# Altium project Audio_Meter_V3.2.PrjPcb (part 2 of 6)

## Sheet Audio_Section.SchDoc
size A; DocumentNumber: 6; SheetNumber: 6; SheetTotal: 8
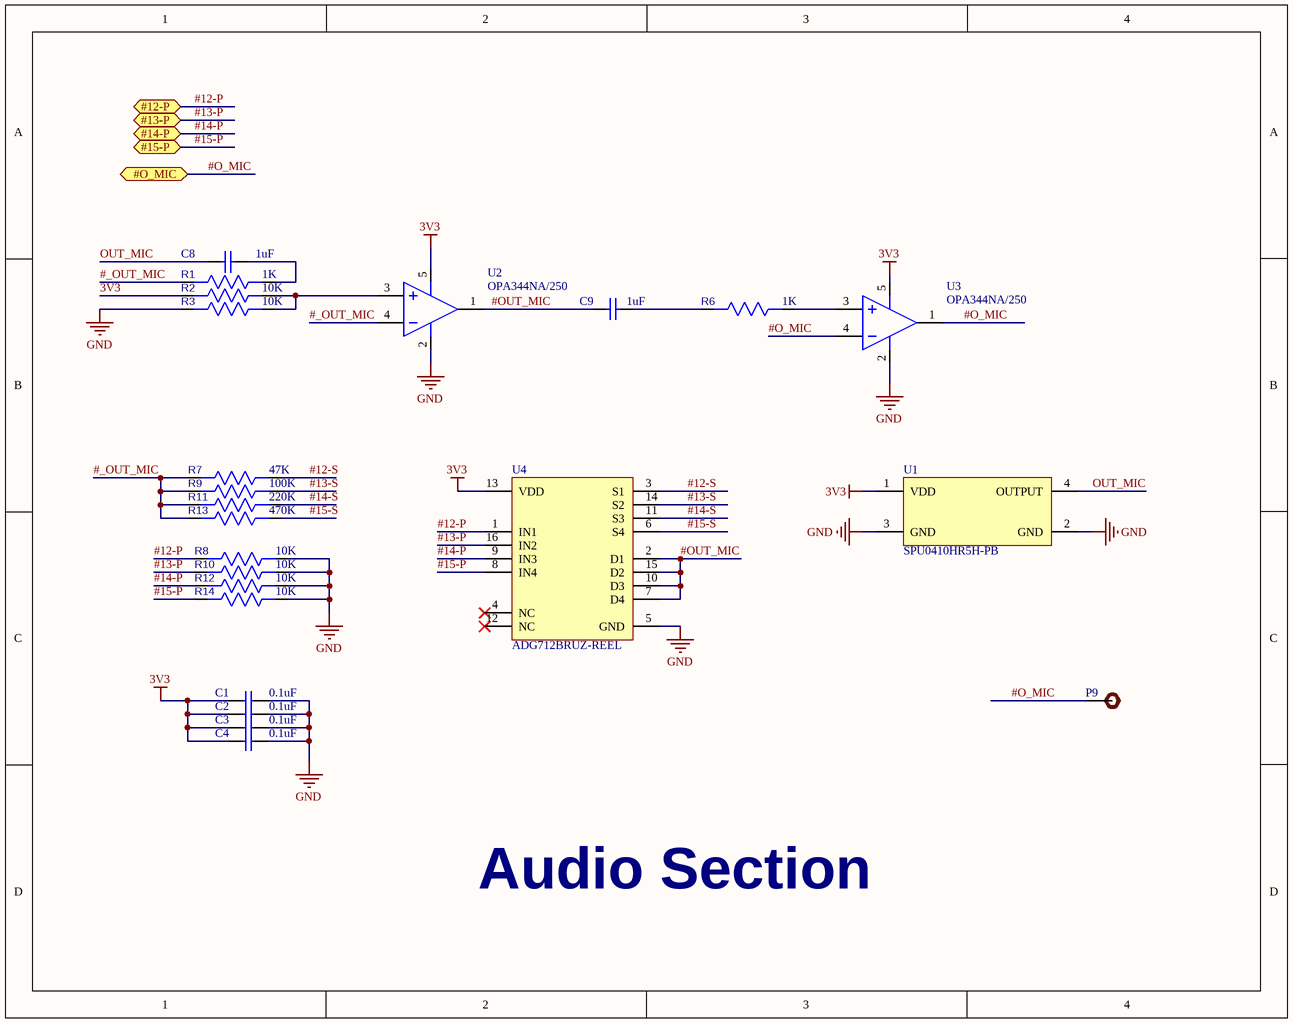
[diagram p2: Audio_Section.SchDoc]

### Parts
C1  0.1uF  [Cap0805]
C2  0.1uF  [Cap0805]
C3  0.1uF  [Cap0805]
C4  0.1uF  [Cap0805]
C8  Capacitance: 1uF  [Cap1206]  (hidden comment: 1206YC105K4T2A)
C9  Capacitance: 1uF  [Cap1206]  (hidden comment: 1206YC105K4T2A)
P9  TEST POINT  [TEST POINT]  (value not drawn)
R1  1K  [RES0805]
R2  10K  [RES0805]
R3  10K  [RES0805]
R6  1K  [RES0805]
R7  47K  [RES0805]
R8  10K  [RES0805]
R9  100K  [RES0805]
R10  10K  [RES0805]
R11  220K  [RES0805]
R12  10K  [RES0805]
R13  470K  [RES0805]
R14  10K  [RES0805]
U1  SPU0410HR5H-PB  [SPU0410HR5H-PB]
U2  OPA344NA/250  [SOT23-5]
U3  OPA344NA/250  [SOT23-5]
U4  ADG712BRUZ-REEL  [16-TSSOP]

### Ports
#12-P (bidir), #13-P (bidir), #14-P (bidir), #15-P (bidir), #O_MIC (bidir)

### Nets
3V3: C1.1 C2.1 C3.1 C4.1 R2.2 U1.1(VDD) U2.5(V+) U3.5(V+) U4.13(VDD)
GND: C1.2 C2.2 C3.2 C4.2 R3.2 R8.1 R10.1 R12.1 R14.1 U1.2(GND) U1.3(GND) U2.2(V-) U3.2(V-) U4.5(GND)
#12-P: R8.2 U4.1(IN1) ; port #12-P
#12-S: R7.1 U4.3(S1)
#13-P: R10.2 U4.16(IN2) ; port #13-P
#13-S: R9.1 U4.14(S2)
#14-P: R12.2 U4.9(IN3) ; port #14-P
#14-S: R11.1 U4.11(S3)
#15-P: R14.2 U4.8(IN4) ; port #15-P
#15-S: R13.1 U4.6(S4)
#_OUT_MIC: R1.2 R7.2 R9.2 R11.2 R13.2 U2.4(IN-)
#O_MIC: P9.1 U3.1(OUT) U3.4(IN-) ; port #O_MIC
#OUT_MIC: C9.1 U2.1(OUT) U4.2(D1) U4.7(D4) U4.10(D3) U4.15(D2)
OUT_MIC: C8.1 U1.4(OUTPUT)
NetC8_2: C8.2 R1.1
NetC9_2: C9.2 R6.2
NetR2_1: R2.1 R3.1 U2.3(IN+)
NetR6_1: R6.1 U3.3(IN+)

Not connected (* = marked no-connect by the designer): U4 4(NC)* 12(NC)*

### Notes on the sheet
- Audio Section

### Library data of the parts
C1-C4 = CL21F104ZBCNNNC: CAP CER 0.1UF 50V Y5V 0805; Manufacturer: Samsung; Material: Ceramic; Capacitance: 100nF; Tolerance: 80%; Supplier 1: Digi-Key; Manufacturer Part Number: CL21F104ZBCNNNC; Stock 1: 4901061; Pricing 1: 1=0.1, 10=0.044, 100=0.0195, 500=0.0139, 1000=0.01092 (USD); Mount: Surface Mount; Case/Package: 0805; Case Code (Metric): 2012; Case Code (Imperial): 0805; Min Operating Temperature: -30°C; Max Operating Temperature: 85°C; Dielectric: Y5V; Packaging: Tape and Reel; Voltage Rating: 50V; Package Quantity: 1; Length: 2mm; Height: 0.85mm; Width: 0.049inch; Thickness: 0.037inch; Depth: 1.25mm; Radiation Hardening: No; ComponentLink1URL: https://media.digikey.com/pdf/Data%20Sheets/Samsung%20PDFs/CL_Series_MLCC_ds.pdf?src-supplier=Digi-Key; ComponentLink1Description: https://media.digikey.com/pdf/Data%20Sheets/Samsung%20PDFs/CL_Series_MLCC_ds.pdf?src-supplier=Digi-Key; Supplier Part Number 1: 1276-1007-6-ND
C8 C9 = 1206YC105K4T2A: CAP CER 1UF 16V X7R 1206; Manufacturer: Kyocera AVX; Tolerance: 10%; Supplier 1: Digi-Key; Manufacturer Part Number: 1206YC105K4T2A; Stock 1: 1895; Pricing 1: 1=0.41, 10=0.285, 100=0.1708, 500=0.12808, 1000=0.10816 (USD); Mount: Surface Mount; Case/Package: 1206; Case Code (Imperial): 1206; Case Code (Metric): 3216; Min Operating Temperature: -55°C; Max Operating Temperature: 125°C; Dielectric: X7R; Package Quantity: 2000; Voltage Rating: 16V; Voltage Rating (DC): 16V; Packaging: Tape and Reel; Termination: SMD/SMT; Length: 3.2mm; Depth: 1.6mm; Width: 1.6mm; Thickness: 0.037inch; Ratings: AEC-Q200; Radiation Hardening: No; Lead Free: Lead Free; ComponentLink1URL: http://www.mouser.com/ds/2/40/AutoMLCC-777028.pdf?src-supplier=Mouser; ComponentLink1Description: http://www.mouser.com/ds/2/40/AutoMLCC-777028.pdf?src-supplier=Mouser; ComponentLink2URL: http://www.avxcorp.com/docs/Catalogs/cauto.pdf?src-supplier=Avnet; ComponentLink2Description: http://www.avxcorp.com/docs/Catalogs/cauto.pdf?src-supplier=Avnet; ComponentLink3URL: http://www.avx.com/docs/Catalogs/cauto.pdf?src-supplier=Future+Electronics; ComponentLink3Description: http://www.avx.com/docs/Catalogs/cauto.pdf?src-supplier=Future+Electronics; ComponentLink4URL: http://www.avx.com/docs/Catalogs/cx7r.pdf?src-supplier=Digi-Key; ComponentLink4Description: http://www.avx.com/docs/Catalogs/cx7r.pdf?src-supplier=Digi-Key; Supplier Part Number 1: 478-10899-1-ND
P9 = TEST POINT: Test Point ON
R1 R6 = ERJ-P06J102V: RES SMD 1K OHM 5% 1/2W 0805; Manufacturer: Panasonic; Power Rating: 500mW; Voltage Rating: 400V; Temperature Coefficient: 200ppm/°C; Voltage Rating (DC): 150V; ComponentLink1URL: https://datasheet.ciiva.com/2474/crcwhpe3-2474640.pdf; ComponentLink1Description: https://datasheet.ciiva.com/2474/crcwhpe3-2474640.pdf; ComponentLink2URL: https://datasheet.ciiva.com/48527/crcwhpe3-48527638.pdf; ComponentLink2Description: https://datasheet.ciiva.com/48527/crcwhpe3-48527638.pdf; ComponentLink3URL: https://datasheet.ciiva.com/5547/crcwhpe3-46056-5547896.pdf; ComponentLink3Description: https://datasheet.ciiva.com/5547/crcwhpe3-46056-5547896.pdf; ComponentLink4URL: https://datasheet.ciiva.com/9112/crcwhpe3-9112140.pdf; ComponentLink4Description: https://datasheet.ciiva.com/9112/crcwhpe3-9112140.pdf; ComponentLink5URL: https://datasheet.ciiva.com/2474/crcwhpe3-2474638.pdf; ComponentLink5Description: https://datasheet.ciiva.com/2474/crcwhpe3-2474638.pdf; ComponentLink6URL: https://datasheet.ciiva.com/2474/crcwhpe3-2474639.pdf; ComponentLink6Description: https://datasheet.ciiva.com/2474/crcwhpe3-2474639.pdf; ComponentLink7URL: https://datasheet.ciiva.com/2474/crcwhpe3-2474641.pdf; ComponentLink7Description: https://datasheet.ciiva.com/2474/crcwhpe3-2474641.pdf; ComponentLink8URL: https://datasheet.ciiva.com/2474/crcwhpe3-2474642.pdf; ComponentLink8Description: https://datasheet.ciiva.com/2474/crcwhpe3-2474642.pdf; ComponentLink9URL: https://datasheet.ciiva.com/2474/crcwhpe3-2474643.pdf; ComponentLink9Description: https://datasheet.ciiva.com/2474/crcwhpe3-2474643.pdf; ComponentLink10URL: https://datasheet.ciiva.com/9051/crcwhpe3-9051301.pdf; ComponentLink10Description: https://datasheet.ciiva.com/9051/crcwhpe3-9051301.pdf; Supplier 1: Digi-Key; Manufacturer Part Number: ERJ-P06J102V; Stock 1: 475568; Pricing 1: 1=0.11, 10=0.103, 100=0.0396, 1000=0.0174, 2500=0.0151 (USD); Mount: Surface Mount; Case/Package: 0805; Weight: 0.000194oz; Case Code (Metric): 2012; Case Code (Imperial): 0805; Contact Plating: Tin; Min Operating Temperature: -55°C; Max Operating Temperature: 155°C; Resistance: 1K; Tolerance: 5%; Packaging: Tape and Reel; Package Quantity: 1; Composition: Thick Film; Number of Terminations: 2; Termination: SMD/SMT; Military Standard: Not; Max Power Dissipation: 500mW; Features: Automotive AEC-Q200; Length: 2mm; Height: 0.6mm; Width: 0.049inch; Depth: 1.25mm; Radiation Hardening: No; REACH SVHC: Unknown; Lead Free: Lead Free; ComponentLink11URL: http://uk.rs-online.com/webdocs/12cb/0900766b812cb812.pdf?src-supplier=RSComponents; ComponentLink11Description: http://uk.rs-online.com/webdocs/12cb/0900766b812cb812.pdf?src-supplier=RSComponents; ComponentLink12URL: http://www.mouser.com/ds/2/315/AOA0000C291-1101061.pdf?src-supplier=Mouser; ComponentLink12Description: http://www.mouser.com/ds/2/315/AOA0000C291-1101061.pdf?src-supplier=Mouser; ComponentLink13URL: http://www.industrial.panasonic.com/www-data/pdf/AOA0000/AOA0000CE4.pdf?src-supplier=Element14; ComponentLink13Description: http://www.industrial.panasonic.com/www-data/pdf/AOA0000/AOA0000CE4.pdf?src-supplier=Element14; ComponentLink14URL: http://industrial.panasonic.com/www-data/pdf/AOA0000/AOA0000CE4.pdf?src-supplier=Avnet+Europe; ComponentLink14Description: http://industrial.panasonic.com/www-data/pdf/AOA0000/AOA0000CE4.pdf?src-supplier=Avnet+Europe; ComponentLink15URL: http://www.farnell.com/datasheets/2059624.pdf?src-supplier=Farnell; ComponentLink15Description: http://www.farnell.com/datasheets/2059624.pdf?src-supplier=Farnell; ComponentLink16URL: https://www.alliedelec.com/m/d/12e4be79354a6c30aae91f11e8182ea0.pdf?src-supplier=Allied+Electronics; ComponentLink16Description: https://www.alliedelec.com/m/d/12e4be79354a6c30aae91f11e8182ea0.pdf?src-supplier=Allied+Electronics; Supplier Part Number 1: P1.0KADCT-ND
R2 R3 R8 R10 R12 R14 = ERJ-P06J103V: RES SMD 10K OHM 5% 1/2W 0805; Manufacturer: Panasonic; Power Rating: 500mW; Voltage Rating: 400V; Temperature Coefficient: 200ppm/°C; Voltage Rating (DC): 150V; ComponentLink1URL: https://www.verical.com/server-webapp/html/getDatasheet?partID=409513; ComponentLink1Description: https://www.verical.com/server-webapp/html/getDatasheet?partID=409513; ComponentLink2URL: http://components.arrow.com/part/dataview/44988207S7163511N1174; ComponentLink2Description: http://components.arrow.com/part/dataview/44988207S7163511N1174; ComponentLink3URL: https://www.seielect.com/Catalog/SEI-RMCF_RMCP.pdf; ComponentLink3Description: https://www.seielect.com/Catalog/SEI-RMCF_RMCP.pdf; ComponentLink4URL: http://www.seielect.com/catalog/sei-rmc.pdf; ComponentLink4Description: http://www.seielect.com/catalog/sei-rmc.pdf; ComponentLink5URL: https://datasheet.ciiva.com/7777/424479-7777391.pdf; ComponentLink5Description: https://datasheet.ciiva.com/7777/424479-7777391.pdf; ComponentLink6URL: https://datasheet.ciiva.com/2581/crcwhpe3-2581488.pdf; ComponentLink6Description: https://datasheet.ciiva.com/2581/crcwhpe3-2581488.pdf; ComponentLink7URL: https://datasheet.ciiva.com/11808/0900766b80d98b26-11808546.pdf; ComponentLink7Description: https://datasheet.ciiva.com/11808/0900766b80d98b26-11808546.pdf; ComponentLink8URL: https://datasheet.ciiva.com/8934/dcrcwe3-8934585.pdf; ComponentLink8Description: https://datasheet.ciiva.com/8934/dcrcwe3-8934585.pdf; ComponentLink9URL: https://datasheet.ciiva.com/2467/dcrcwe3-2467241.pdf; ComponentLink9Description: https://datasheet.ciiva.com/2467/dcrcwe3-2467241.pdf; ComponentLink10URL: https://datasheet.ciiva.com/7777/1697337-7777401.pdf; ComponentLink10Description: https://datasheet.ciiva.com/7777/1697337-7777401.pdf; ComponentLink11URL: https://datasheet.ciiva.com/16852/dcrcwe3-16852347.pdf; ComponentLink11Description: https://datasheet.ciiva.com/16852/dcrcwe3-16852347.pdf; ComponentLink12URL: https://datasheet.ciiva.com/16200/dcrcwe3-16200123.pdf; ComponentLink12Description: https://datasheet.ciiva.com/16200/dcrcwe3-16200123.pdf; ComponentLink13URL: https://datasheet.ciiva.com/16725/70201119-16725227.pdf; ComponentLink13Description: https://datasheet.ciiva.com/16725/70201119-16725227.pdf; ComponentLink14URL: https://datasheet.ciiva.com/2467/dcrcwe3-2467239.pdf; ComponentLink14Description: https://datasheet.ciiva.com/2467/dcrcwe3-2467239.pdf; ComponentLink15URL: https://datasheet.ciiva.com/7777/1720486-7777575.pdf; ComponentLink15Description: https://datasheet.ciiva.com/7777/1720486-7777575.pdf; ComponentLink16URL: https://datasheet.ciiva.com/8934/dcrcwe3-8934581.pdf; ComponentLink16Description: https://datasheet.ciiva.com/8934/dcrcwe3-8934581.pdf; ComponentLink17URL: https://datasheet.ciiva.com/2467/dcrcwe3-2467240.pdf; ComponentLink17Description: https://datasheet.ciiva.com/2467/dcrcwe3-2467240.pdf; ComponentLink18URL: https://datasheet.ciiva.com/7777/1720486-7777576.pdf; ComponentLink18Description: https://datasheet.ciiva.com/7777/1720486-7777576.pdf; ComponentLink19URL: https://datasheet.ciiva.com/5546/dcrcwe3-109170-5546983.pdf; ComponentLink19Description: https://datasheet.ciiva.com/5546/dcrcwe3-109170-5546983.pdf; ComponentLink20URL: https://datasheet.ciiva.com/16755/70201119-16755757.pdf; ComponentLink20Description: https://datasheet.ciiva.com/16755/70201119-16755757.pdf; ComponentLink21URL: https://datasheet.ciiva.com/3258/dcrcwe3-3258221.pdf; ComponentLink21Description: https://datasheet.ciiva.com/3258/dcrcwe3-3258221.pdf; ComponentLink22URL: https://datasheet.ciiva.com/17204/dcrcwe3-17204398.pdf; ComponentLink22Description: https://datasheet.ciiva.com/17204/dcrcwe3-17204398.pdf; ComponentLink23URL: https://datasheet.ciiva.com/16435/dcrcwe3-16435934.pdf; ComponentLink23Description: https://datasheet.ciiva.com/16435/dcrcwe3-16435934.pdf; ComponentLink24URL: https://datasheet.ciiva.com/46441/1533075-46441628.pdf; ComponentLink24Description: https://datasheet.ciiva.com/46441/1533075-46441628.pdf; ComponentLink25URL: https://datasheet.ciiva.com/5544/dcrcwe3-109170-5544649.pdf; ComponentLink25Description: https://datasheet.ciiva.com/5544/dcrcwe3-109170-5544649.pdf; ComponentLink26URL: https://datasheet.ciiva.com/8337/dcrcwe3-8337669.pdf; ComponentLink26Description: https://datasheet.ciiva.com/8337/dcrcwe3-8337669.pdf; ComponentLink27URL: https://datasheet.ciiva.com/2463/dcrcwe3-2463179.pdf; ComponentLink27Description: https://datasheet.ciiva.com/2463/dcrcwe3-2463179.pdf; ComponentLink28URL: https://datasheet.ciiva.com/2463/dcrcwe3-2463178.pdf; ComponentLink28Description: https://datasheet.ciiva.com/2463/dcrcwe3-2463178.pdf; ComponentLink29URL: https://datasheet.ciiva.com/2474/crcwhpe3-2474640.pdf; ComponentLink29Description: https://datasheet.ciiva.com/2474/crcwhpe3-2474640.pdf; ComponentLink30URL: https://datasheet.ciiva.com/48527/crcwhpe3-48527638.pdf; ComponentLink30Description: https://datasheet.ciiva.com/48527/crcwhpe3-48527638.pdf; ComponentLink31URL: https://datasheet.ciiva.com/5547/crcwhpe3-46056-5547896.pdf; ComponentLink31Description: https://datasheet.ciiva.com/5547/crcwhpe3-46056-5547896.pdf; ComponentLink32URL: https://datasheet.ciiva.com/9112/crcwhpe3-9112140.pdf; ComponentLink32Description: https://datasheet.ciiva.com/9112/crcwhpe3-9112140.pdf; ComponentLink33URL: https://datasheet.ciiva.com/2474/crcwhpe3-2474638.pdf; ComponentLink33Description: https://datasheet.ciiva.com/2474/crcwhpe3-2474638.pdf; ComponentLink34URL: https://datasheet.ciiva.com/2474/crcwhpe3-2474639.pdf; ComponentLink34Description: https://datasheet.ciiva.com/2474/crcwhpe3-2474639.pdf; Supplier 1: Digi-Key; Manufacturer Part Number: ERJ-P06J103V; Stock 1: 130484; Pricing 1: 1=0.11, 10=0.103, 100=0.0396, 1000=0.0174, 2500=0.0151 (USD); Mount: Surface Mount; Case/Package: 0805; Weight: 0.000194oz; Case Code (Metric): 2012; Case Code (Imperial): 0805; Contact Plating: Tin; Min Operating Temperature: -55°C; Max Operating Temperature: 155°C; Resistance: 10K; Tolerance: 5%; Packaging: Tape and Reel; Package Quantity: 1; Composition: Thick Film; Number of Terminations: 2; Termination: SMD/SMT; Military Standard: Not; Max Power Dissipation: 500mW; Features: Automotive AEC-Q200; Length: 2mm; Height: 0.6mm; Width: 0.049inch; Depth: 1.25mm; Radiation Hardening: No; REACH SVHC: Unknown; Lead Free: Lead Free; ComponentLink35URL: http://uk.rs-online.com/webdocs/12cb/0900766b812cb812.pdf?src-supplier=RSComponents; ComponentLink35Description: http://uk.rs-online.com/webdocs/12cb/0900766b812cb812.pdf?src-supplier=RSComponents; ComponentLink36URL: http://industrial.panasonic.com/www-data/pdf/AOA0000/AOA0000CE4.pdf?src-supplier=Avnet; ComponentLink36Description: http://industrial.panasonic.com/www-data/pdf/AOA0000/AOA0000CE4.pdf?src-supplier=Avnet; ComponentLink37URL: http://industrial.panasonic.com/www-data/pdf/AOA0000/AOA0000CE4.pdf?src-supplier=Future+Electronics; ComponentLink37Description: http://industrial.panasonic.com/www-data/pdf/AOA0000/AOA0000CE4.pdf?src-supplier=Future+Electronics; ComponentLink38URL: http://www.farnell.com/datasheets/2059624.pdf?src-supplier=Element14; ComponentLink38Description: http://www.farnell.com/datasheets/2059624.pdf?src-supplier=Element14; ComponentLink39URL: https://www.alliedelec.com/m/d/12e4be79354a6c30aae91f11e8182ea0.pdf?src-supplier=Allied+Electronics; ComponentLink39Description: https://www.alliedelec.com/m/d/12e4be79354a6c30aae91f11e8182ea0.pdf?src-supplier=Allied+Electronics; ComponentLink40URL: http://www.farnell.com/datasheets/2059624.pdf?src-supplier=Farnell; ComponentLink40Description: http://www.farnell.com/datasheets/2059624.pdf?src-supplier=Farnell; Supplier Part Number 1: P10KADCT-ND
R7 = CRCW080547K0FKEAHP: RES SMD 47K OHM 1% 1/3W 0805; Manufacturer: Vishay; Power Rating: 330mW; Temperature Coefficient: 100ppm/°C; Voltage Rating: 150V; Max Power Dissipation: 333mW; ComponentLink1URL: https://www.verical.com/server-webapp/html/getDatasheet?partID=409513; ComponentLink1Description: https://www.verical.com/server-webapp/html/getDatasheet?partID=409513; ComponentLink2URL: http://components.arrow.com/part/dataview/44988207S7163511N1174; ComponentLink2Description: http://components.arrow.com/part/dataview/44988207S7163511N1174; ComponentLink3URL: https://www.seielect.com/Catalog/SEI-RMCF_RMCP.pdf; ComponentLink3Description: https://www.seielect.com/Catalog/SEI-RMCF_RMCP.pdf; ComponentLink4URL: http://www.seielect.com/catalog/sei-rmc.pdf; ComponentLink4Description: http://www.seielect.com/catalog/sei-rmc.pdf; ComponentLink5URL: https://datasheet.ciiva.com/7777/424479-7777391.pdf; ComponentLink5Description: https://datasheet.ciiva.com/7777/424479-7777391.pdf; ComponentLink6URL: https://datasheet.ciiva.com/2581/crcwhpe3-2581488.pdf; ComponentLink6Description: https://datasheet.ciiva.com/2581/crcwhpe3-2581488.pdf; ComponentLink7URL: https://datasheet.ciiva.com/11808/0900766b80d98b26-11808546.pdf; ComponentLink7Description: https://datasheet.ciiva.com/11808/0900766b80d98b26-11808546.pdf; ComponentLink8URL: https://datasheet.ciiva.com/8934/dcrcwe3-8934585.pdf; ComponentLink8Description: https://datasheet.ciiva.com/8934/dcrcwe3-8934585.pdf; ComponentLink9URL: https://datasheet.ciiva.com/2467/dcrcwe3-2467241.pdf; ComponentLink9Description: https://datasheet.ciiva.com/2467/dcrcwe3-2467241.pdf; ComponentLink10URL: https://datasheet.ciiva.com/7777/1697337-7777401.pdf; ComponentLink10Description: https://datasheet.ciiva.com/7777/1697337-7777401.pdf; ComponentLink11URL: https://datasheet.ciiva.com/16852/dcrcwe3-16852347.pdf; ComponentLink11Description: https://datasheet.ciiva.com/16852/dcrcwe3-16852347.pdf; ComponentLink12URL: https://datasheet.ciiva.com/16200/dcrcwe3-16200123.pdf; ComponentLink12Description: https://datasheet.ciiva.com/16200/dcrcwe3-16200123.pdf; ComponentLink13URL: https://datasheet.ciiva.com/16725/70201119-16725227.pdf; ComponentLink13Description: https://datasheet.ciiva.com/16725/70201119-16725227.pdf; ComponentLink14URL: https://datasheet.ciiva.com/2467/dcrcwe3-2467239.pdf; ComponentLink14Description: https://datasheet.ciiva.com/2467/dcrcwe3-2467239.pdf; ComponentLink15URL: https://datasheet.ciiva.com/7777/1720486-7777575.pdf; ComponentLink15Description: https://datasheet.ciiva.com/7777/1720486-7777575.pdf; ComponentLink16URL: https://datasheet.ciiva.com/8934/dcrcwe3-8934581.pdf; ComponentLink16Description: https://datasheet.ciiva.com/8934/dcrcwe3-8934581.pdf; ComponentLink17URL: https://datasheet.ciiva.com/2467/dcrcwe3-2467240.pdf; ComponentLink17Description: https://datasheet.ciiva.com/2467/dcrcwe3-2467240.pdf; ComponentLink18URL: https://datasheet.ciiva.com/7777/1720486-7777576.pdf; ComponentLink18Description: https://datasheet.ciiva.com/7777/1720486-7777576.pdf; ComponentLink19URL: https://datasheet.ciiva.com/5546/dcrcwe3-109170-5546983.pdf; ComponentLink19Description: https://datasheet.ciiva.com/5546/dcrcwe3-109170-5546983.pdf; ComponentLink20URL: http://www.vishay.com/docs/20043/crcwhpe3.pdf?src-supplier=Digi-Key; ComponentLink20Description: http://www.vishay.com/docs/20043/crcwhpe3.pdf?src-supplier=Digi-Key; ComponentLink21URL: http://www.mouser.com/ds/2/427/crcwhpe3-46056.pdf?src-supplier=Mouser; ComponentLink21Description: http://www.mouser.com/ds/2/427/crcwhpe3-46056.pdf?src-supplier=Mouser; ComponentLink22URL: http://www.farnell.com/datasheets/2140397.pdf?src-supplier=Element14; ComponentLink22Description: http://www.farnell.com/datasheets/2140397.pdf?src-supplier=Element14; Supplier 1: Arrow; Manufacturer Part Number: CRCW080547K0FKEAHP; Stock 1: 55; Pricing 1: 1=0.2375, 10=0.2014, 25=0.1942 (USD); Mount: Surface Mount; Case/Package: 0805; Weight: 0.000194oz; Case Code (Imperial): 0805; Case Code (Metric): 2012; Contact Plating: Tin; Min Operating Temperature: -55°C; Max Operating Temperature: 155°C; Tolerance: 1%; Resistance: 47K; Packaging: Cut Tape; Package Quantity: 10; Termination: SMD/SMT; Composition: Thick Film; Number of Terminations: 2; Voltage Rating (DC): 150V; Features: Automotive AEC-Q200; Length: 2mm; Height: 0.024inch; Width: 1.2mm; Depth: 1.25mm; Lead Free: Lead Free; REACH SVHC: Unknown; ComponentLink23URL: http://www.vishay.com/docs/20043/crcwhpe3.pdf?src-supplier=Avnet; ComponentLink23Description: http://www.vishay.com/docs/20043/crcwhpe3.pdf?src-supplier=Avnet; Supplier Part Number 1: CRCW080547K0FKEAHP
R9 = ERJ-P06J104V: RES SMD 100K OHM 5% 1/2W 0805; Manufacturer: Panasonic; Power Rating: 500mW; Voltage Rating: 400V; Temperature Coefficient: 200ppm/°C; Max Power Dissipation: 250mW; Voltage Rating (DC): 150V; ComponentLink1URL: https://www.verical.com/server-webapp/html/getDatasheet?partID=409513; ComponentLink1Description: https://www.verical.com/server-webapp/html/getDatasheet?partID=409513; ComponentLink2URL: http://components.arrow.com/part/dataview/44988207S7163511N1174; ComponentLink2Description: http://components.arrow.com/part/dataview/44988207S7163511N1174; ComponentLink3URL: https://www.seielect.com/Catalog/SEI-RMCF_RMCP.pdf; ComponentLink3Description: https://www.seielect.com/Catalog/SEI-RMCF_RMCP.pdf; ComponentLink4URL: http://www.seielect.com/catalog/sei-rmc.pdf; ComponentLink4Description: http://www.seielect.com/catalog/sei-rmc.pdf; ComponentLink5URL: https://datasheet.ciiva.com/7777/424479-7777391.pdf; ComponentLink5Description: https://datasheet.ciiva.com/7777/424479-7777391.pdf; ComponentLink6URL: https://datasheet.ciiva.com/2581/crcwhpe3-2581488.pdf; ComponentLink6Description: https://datasheet.ciiva.com/2581/crcwhpe3-2581488.pdf; ComponentLink7URL: https://datasheet.ciiva.com/11808/0900766b80d98b26-11808546.pdf; ComponentLink7Description: https://datasheet.ciiva.com/11808/0900766b80d98b26-11808546.pdf; ComponentLink8URL: https://datasheet.ciiva.com/8934/dcrcwe3-8934585.pdf; ComponentLink8Description: https://datasheet.ciiva.com/8934/dcrcwe3-8934585.pdf; ComponentLink9URL: https://datasheet.ciiva.com/2467/dcrcwe3-2467241.pdf; ComponentLink9Description: https://datasheet.ciiva.com/2467/dcrcwe3-2467241.pdf; ComponentLink10URL: https://datasheet.ciiva.com/7777/1697337-7777401.pdf; ComponentLink10Description: https://datasheet.ciiva.com/7777/1697337-7777401.pdf; ComponentLink11URL: https://datasheet.ciiva.com/16852/dcrcwe3-16852347.pdf; ComponentLink11Description: https://datasheet.ciiva.com/16852/dcrcwe3-16852347.pdf; ComponentLink12URL: https://datasheet.ciiva.com/16200/dcrcwe3-16200123.pdf; ComponentLink12Description: https://datasheet.ciiva.com/16200/dcrcwe3-16200123.pdf; ComponentLink13URL: https://datasheet.ciiva.com/16725/70201119-16725227.pdf; ComponentLink13Description: https://datasheet.ciiva.com/16725/70201119-16725227.pdf; ComponentLink14URL: https://datasheet.ciiva.com/2467/dcrcwe3-2467239.pdf; ComponentLink14Description: https://datasheet.ciiva.com/2467/dcrcwe3-2467239.pdf; ComponentLink15URL: https://datasheet.ciiva.com/7777/1720486-7777575.pdf; ComponentLink15Description: https://datasheet.ciiva.com/7777/1720486-7777575.pdf; ComponentLink16URL: https://datasheet.ciiva.com/8934/dcrcwe3-8934581.pdf; ComponentLink16Description: https://datasheet.ciiva.com/8934/dcrcwe3-8934581.pdf; ComponentLink17URL: https://datasheet.ciiva.com/2467/dcrcwe3-2467240.pdf; ComponentLink17Description: https://datasheet.ciiva.com/2467/dcrcwe3-2467240.pdf; ComponentLink18URL: https://datasheet.ciiva.com/7777/1720486-7777576.pdf; ComponentLink18Description: https://datasheet.ciiva.com/7777/1720486-7777576.pdf; ComponentLink19URL: https://datasheet.ciiva.com/5546/dcrcwe3-109170-5546983.pdf; ComponentLink19Description: https://datasheet.ciiva.com/5546/dcrcwe3-109170-5546983.pdf; ComponentLink20URL: https://datasheet.ciiva.com/16755/70201119-16755757.pdf; ComponentLink20Description: https://datasheet.ciiva.com/16755/70201119-16755757.pdf; ComponentLink21URL: https://datasheet.ciiva.com/3258/dcrcwe3-3258221.pdf; ComponentLink21Description: https://datasheet.ciiva.com/3258/dcrcwe3-3258221.pdf; ComponentLink22URL: https://datasheet.ciiva.com/17204/dcrcwe3-17204398.pdf; ComponentLink22Description: https://datasheet.ciiva.com/17204/dcrcwe3-17204398.pdf; ComponentLink23URL: https://datasheet.ciiva.com/16435/dcrcwe3-16435934.pdf; ComponentLink23Description: https://datasheet.ciiva.com/16435/dcrcwe3-16435934.pdf; ComponentLink24URL: https://datasheet.ciiva.com/46441/1533075-46441628.pdf; ComponentLink24Description: https://datasheet.ciiva.com/46441/1533075-46441628.pdf; ComponentLink25URL: https://datasheet.ciiva.com/5544/dcrcwe3-109170-5544649.pdf; ComponentLink25Description: https://datasheet.ciiva.com/5544/dcrcwe3-109170-5544649.pdf; ComponentLink26URL: https://datasheet.ciiva.com/8337/dcrcwe3-8337669.pdf; ComponentLink26Description: https://datasheet.ciiva.com/8337/dcrcwe3-8337669.pdf; ComponentLink27URL: https://datasheet.ciiva.com/2463/dcrcwe3-2463179.pdf; ComponentLink27Description: https://datasheet.ciiva.com/2463/dcrcwe3-2463179.pdf; ComponentLink28URL: https://datasheet.ciiva.com/2463/dcrcwe3-2463178.pdf; ComponentLink28Description: https://datasheet.ciiva.com/2463/dcrcwe3-2463178.pdf; ComponentLink29URL: https://datasheet.ciiva.com/2474/crcwhpe3-2474640.pdf; ComponentLink29Description: https://datasheet.ciiva.com/2474/crcwhpe3-2474640.pdf; ComponentLink30URL: https://datasheet.ciiva.com/48527/crcwhpe3-48527638.pdf; ComponentLink30Description: https://datasheet.ciiva.com/48527/crcwhpe3-48527638.pdf; ComponentLink31URL: https://datasheet.ciiva.com/5547/crcwhpe3-46056-5547896.pdf; ComponentLink31Description: https://datasheet.ciiva.com/5547/crcwhpe3-46056-5547896.pdf; ComponentLink32URL: https://datasheet.ciiva.com/9112/crcwhpe3-9112140.pdf; ComponentLink32Description: https://datasheet.ciiva.com/9112/crcwhpe3-9112140.pdf; ComponentLink33URL: https://datasheet.ciiva.com/2474/crcwhpe3-2474638.pdf; ComponentLink33Description: https://datasheet.ciiva.com/2474/crcwhpe3-2474638.pdf; ComponentLink34URL: https://datasheet.ciiva.com/2474/crcwhpe3-2474639.pdf; ComponentLink34Description: https://datasheet.ciiva.com/2474/crcwhpe3-2474639.pdf; ComponentLink35URL: http://uk.rs-online.com/webdocs/12cb/0900766b812cb812.pdf?src-supplier=RSComponents; ComponentLink35Description: http://uk.rs-online.com/webdocs/12cb/0900766b812cb812.pdf?src-supplier=RSComponents; ComponentLink36URL: http://industrial.panasonic.com/www-data/pdf/AOA0000/AOA0000CE4.pdf?src-supplier=Avnet; ComponentLink36Description: http://industrial.panasonic.com/www-data/pdf/AOA0000/AOA0000CE4.pdf?src-supplier=Avnet; ComponentLink37URL: http://industrial.panasonic.com/www-data/pdf/AOA0000/AOA0000CE4.pdf?src-supplier=Future+Electronics; ComponentLink37Description: http://industrial.panasonic.com/www-data/pdf/AOA0000/AOA0000CE4.pdf?src-supplier=Future+Electronics; ComponentLink38URL: http://www.farnell.com/datasheets/2059624.pdf?src-supplier=Element14; ComponentLink38Description: http://www.farnell.com/datasheets/2059624.pdf?src-supplier=Element14; ComponentLink39URL: https://www.alliedelec.com/m/d/12e4be79354a6c30aae91f11e8182ea0.pdf?src-supplier=Allied+Electronics; ComponentLink39Description: https://www.alliedelec.com/m/d/12e4be79354a6c30aae91f11e8182ea0.pdf?src-supplier=Allied+Electronics; ComponentLink40URL: http://www.farnell.com/datasheets/2059624.pdf?src-supplier=Farnell; ComponentLink40Description: http://www.farnell.com/datasheets/2059624.pdf?src-supplier=Farnell; Supplier 1: Digi-Key; Manufacturer Part Number: ERJ-P06J104V; Stock 1: 131043; Pricing 1: 1=0.11, 10=0.103, 100=0.0396, 1000=0.0174, 2500=0.0151 (USD); Mount: Surface Mount; Case/Package: 0805; Case Code (Imperial): 0805; Case Code (Metric): 2012; Contact Plating: Tin; Min Operating Temperature: -55°C; Max Operating Temperature: 155°C; Tolerance: 5%; Packaging: Tape and Reel; Resistance: 100K; Package Quantity: 5000; Composition: Thick Film; Number of Terminations: 2; Termination: SMD/SMT; Military Standard: Not; Length: 2mm; Height: 0.6mm; Width: 1.2mm; Depth: 1.25mm; Radiation Hardening: No; REACH SVHC: No SVHC; Lead Free: Lead Free; ComponentLink41URL: http://industrial.panasonic.com/cdbs/www-data/pdf/RDO0000/AOA0000C331.pdf?src-supplier=Newark; ComponentLink41Description: http://industrial.panasonic.com/cdbs/www-data/pdf/RDO0000/AOA0000C331.pdf?src-supplier=Newark; ComponentLink42URL: https://industrial.panasonic.com/ww/system/files/data/download/catalog/id_fixed-resistors_e_1.pdf?src-supplier=Allied+Electronics; ComponentLink42Description: https://industrial.panasonic.com/ww/system/files/data/download/catalog/id_fixed-resistors_e_1.pdf?src-supplier=Allied+Electronics; ComponentLink43URL: http://industrial.panasonic.com/www-data/pdf/AOA0000/AOA0000CE4.pdf?src-supplier=Avnet+Europe; ComponentLink43Description: http://industrial.panasonic.com/www-data/pdf/AOA0000/AOA0000CE4.pdf?src-supplier=Avnet+Europe; Supplier Part Number 1: P100KADCT-ND
R11 = ERJ-P06J224V: RES SMD 220K OHM 5% 1/2W 0805; Manufacturer: Panasonic; Power Rating: 500mW; Voltage Rating: 150V; Temperature Coefficient: 200ppm/°C; ComponentLink1URL: https://datasheet.ciiva.com/2474/crcwhpe3-2474640.pdf; ComponentLink1Description: https://datasheet.ciiva.com/2474/crcwhpe3-2474640.pdf; ComponentLink2URL: https://datasheet.ciiva.com/48527/crcwhpe3-48527638.pdf; ComponentLink2Description: https://datasheet.ciiva.com/48527/crcwhpe3-48527638.pdf; ComponentLink3URL: https://datasheet.ciiva.com/5547/crcwhpe3-46056-5547896.pdf; ComponentLink3Description: https://datasheet.ciiva.com/5547/crcwhpe3-46056-5547896.pdf; ComponentLink4URL: https://datasheet.ciiva.com/9112/crcwhpe3-9112140.pdf; ComponentLink4Description: https://datasheet.ciiva.com/9112/crcwhpe3-9112140.pdf; ComponentLink5URL: https://datasheet.ciiva.com/2474/crcwhpe3-2474638.pdf; ComponentLink5Description: https://datasheet.ciiva.com/2474/crcwhpe3-2474638.pdf; ComponentLink6URL: https://datasheet.ciiva.com/2474/crcwhpe3-2474639.pdf; ComponentLink6Description: https://datasheet.ciiva.com/2474/crcwhpe3-2474639.pdf; ComponentLink7URL: https://datasheet.ciiva.com/2474/crcwhpe3-2474641.pdf; ComponentLink7Description: https://datasheet.ciiva.com/2474/crcwhpe3-2474641.pdf; ComponentLink8URL: https://datasheet.ciiva.com/2474/crcwhpe3-2474642.pdf; ComponentLink8Description: https://datasheet.ciiva.com/2474/crcwhpe3-2474642.pdf; ComponentLink9URL: https://datasheet.ciiva.com/2474/crcwhpe3-2474643.pdf; ComponentLink9Description: https://datasheet.ciiva.com/2474/crcwhpe3-2474643.pdf; ComponentLink10URL: https://datasheet.ciiva.com/9051/crcwhpe3-9051301.pdf; ComponentLink10Description: https://datasheet.ciiva.com/9051/crcwhpe3-9051301.pdf; ComponentLink11URL: http://uk.rs-online.com/webdocs/12cb/0900766b812cb812.pdf?src-supplier=RSComponents; ComponentLink11Description: http://uk.rs-online.com/webdocs/12cb/0900766b812cb812.pdf?src-supplier=RSComponents; ComponentLink12URL: http://www.mouser.com/ds/2/315/AOA0000C291-1101061.pdf?src-supplier=Mouser; ComponentLink12Description: http://www.mouser.com/ds/2/315/AOA0000C291-1101061.pdf?src-supplier=Mouser; ComponentLink13URL: http://www.industrial.panasonic.com/www-data/pdf/AOA0000/AOA0000CE4.pdf?src-supplier=Element14; ComponentLink13Description: http://www.industrial.panasonic.com/www-data/pdf/AOA0000/AOA0000CE4.pdf?src-supplier=Element14; ComponentLink14URL: http://industrial.panasonic.com/www-data/pdf/AOA0000/AOA0000CE4.pdf?src-supplier=Avnet+Europe; ComponentLink14Description: http://industrial.panasonic.com/www-data/pdf/AOA0000/AOA0000CE4.pdf?src-supplier=Avnet+Europe; ComponentLink15URL: http://www.farnell.com/datasheets/2059624.pdf?src-supplier=Farnell; ComponentLink15Description: http://www.farnell.com/datasheets/2059624.pdf?src-supplier=Farnell; ComponentLink16URL: https://www.alliedelec.com/m/d/12e4be79354a6c30aae91f11e8182ea0.pdf?src-supplier=Allied+Electronics; ComponentLink16Description: https://www.alliedelec.com/m/d/12e4be79354a6c30aae91f11e8182ea0.pdf?src-supplier=Allied+Electronics; Supplier 1: Digi-Key; Manufacturer Part Number: ERJ-P06J224V; Stock 1: 14636; Pricing 1: 1=0.11, 10=0.103, 100=0.0396, 1000=0.0174, 2500=0.0151 (USD); Mount: Surface Mount; Case/Package: 0805; Case Code (Metric): 2012; Case Code (Imperial): 0805; Contact Plating: Tin; Min Operating Temperature: -55°C; Max Operating Temperature: 155°C; Resistance: 220K; Tolerance: 5%; Packaging: Tape and Reel; Package Quantity: 1; Composition: Thick Film; Number of Terminations: 2; Max Power Dissipation: 500mW; Voltage Rating (DC): 150V; Features: Automotive AEC-Q200; Length: 0.079inch; Height: 0.028inch; Width: 0.049inch; Radiation Hardening: No; Lead Free: Contains Lead; Supplier Part Number 1: P220KADCT-ND
R13 = CRCW0805470KFKEAHP: RES SMD 470K OHM 1% 1/3W 0805; Manufacturer: Vishay Dale; Power Rating: 330mW; Temperature Coefficient: 100ppm/°C; Max Power Dissipation: 500mW; ComponentLink1URL: https://www.verical.com/server-webapp/html/getDatasheet?partID=409513; ComponentLink1Description: https://www.verical.com/server-webapp/html/getDatasheet?partID=409513; ComponentLink2URL: http://components.arrow.com/part/dataview/44988207S7163511N1174; ComponentLink2Description: http://components.arrow.com/part/dataview/44988207S7163511N1174; ComponentLink3URL: https://www.seielect.com/Catalog/SEI-RMCF_RMCP.pdf; ComponentLink3Description: https://www.seielect.com/Catalog/SEI-RMCF_RMCP.pdf; ComponentLink4URL: http://www.seielect.com/catalog/sei-rmc.pdf; ComponentLink4Description: http://www.seielect.com/catalog/sei-rmc.pdf; ComponentLink5URL: https://datasheet.ciiva.com/7777/424479-7777391.pdf; ComponentLink5Description: https://datasheet.ciiva.com/7777/424479-7777391.pdf; ComponentLink6URL: https://datasheet.ciiva.com/2581/crcwhpe3-2581488.pdf; ComponentLink6Description: https://datasheet.ciiva.com/2581/crcwhpe3-2581488.pdf; ComponentLink7URL: https://datasheet.ciiva.com/11808/0900766b80d98b26-11808546.pdf; ComponentLink7Description: https://datasheet.ciiva.com/11808/0900766b80d98b26-11808546.pdf; ComponentLink8URL: https://datasheet.ciiva.com/8934/dcrcwe3-8934585.pdf; ComponentLink8Description: https://datasheet.ciiva.com/8934/dcrcwe3-8934585.pdf; ComponentLink9URL: https://datasheet.ciiva.com/2467/dcrcwe3-2467241.pdf; ComponentLink9Description: https://datasheet.ciiva.com/2467/dcrcwe3-2467241.pdf; ComponentLink10URL: https://datasheet.ciiva.com/7777/1697337-7777401.pdf; ComponentLink10Description: https://datasheet.ciiva.com/7777/1697337-7777401.pdf; ComponentLink11URL: https://datasheet.ciiva.com/16852/dcrcwe3-16852347.pdf; ComponentLink11Description: https://datasheet.ciiva.com/16852/dcrcwe3-16852347.pdf; ComponentLink12URL: https://datasheet.ciiva.com/16200/dcrcwe3-16200123.pdf; ComponentLink12Description: https://datasheet.ciiva.com/16200/dcrcwe3-16200123.pdf; ComponentLink13URL: https://datasheet.ciiva.com/16725/70201119-16725227.pdf; ComponentLink13Description: https://datasheet.ciiva.com/16725/70201119-16725227.pdf; ComponentLink14URL: https://datasheet.ciiva.com/2467/dcrcwe3-2467239.pdf; ComponentLink14Description: https://datasheet.ciiva.com/2467/dcrcwe3-2467239.pdf; ComponentLink15URL: https://datasheet.ciiva.com/7777/1720486-7777575.pdf; ComponentLink15Description: https://datasheet.ciiva.com/7777/1720486-7777575.pdf; ComponentLink16URL: https://datasheet.ciiva.com/8934/dcrcwe3-8934581.pdf; ComponentLink16Description: https://datasheet.ciiva.com/8934/dcrcwe3-8934581.pdf; ComponentLink17URL: https://datasheet.ciiva.com/2467/dcrcwe3-2467240.pdf; ComponentLink17Description: https://datasheet.ciiva.com/2467/dcrcwe3-2467240.pdf; ComponentLink18URL: https://datasheet.ciiva.com/7777/1720486-7777576.pdf; ComponentLink18Description: https://datasheet.ciiva.com/7777/1720486-7777576.pdf; ComponentLink19URL: https://datasheet.ciiva.com/5546/dcrcwe3-109170-5546983.pdf; ComponentLink19Description: https://datasheet.ciiva.com/5546/dcrcwe3-109170-5546983.pdf; ComponentLink20URL: http://www.vishay.com/docs/20043/crcwhpe3.pdf?src-supplier=Digi-Key; ComponentLink20Description: http://www.vishay.com/docs/20043/crcwhpe3.pdf?src-supplier=Digi-Key; ComponentLink21URL: http://www.mouser.com/ds/2/427/crcwhpe3-46056.pdf?src-supplier=Mouser; ComponentLink21Description: http://www.mouser.com/ds/2/427/crcwhpe3-46056.pdf?src-supplier=Mouser; ComponentLink22URL: http://www.farnell.com/datasheets/2140397.pdf?src-supplier=Element14; ComponentLink22Description: http://www.farnell.com/datasheets/2140397.pdf?src-supplier=Element14; ComponentLink23URL: http://www.vishay.com/docs/20043/crcwhpe3.pdf?src-supplier=Avnet; ComponentLink23Description: http://www.vishay.com/docs/20043/crcwhpe3.pdf?src-supplier=Avnet; Supplier 1: Digi-Key; Manufacturer Part Number: CRCW0805470KFKEAHP; Stock 1: 5441; Pricing 1: 1=0.25, 10=0.212, 100=0.0828, 1000=0.0347, 2500=0.0318 (USD); Mount: Surface Mount; Case/Package: 0805; Case Code (Metric): 2012; Case Code (Imperial): 0805; Contact Plating: Tin; Min Operating Temperature: -55°C; Max Operating Temperature: 155°C; Package Quantity: 5000; Resistance: 470K; Tolerance: 1%; Packaging: Tape and Reel; Composition: Thick Film; Termination: Wraparound; Number of Terminations: 2; Features: Automotive AEC-Q200; Length: 0.079inch; Height: 0.024inch; Width: 0.049inch; Lead Free: Lead Free; Supplier Part Number 1: 541-470KTCT-ND
U1 = SPU0410HR5H-PB: SPU-TOP MIC IOT FOCUSED MIC; Manufacturer: Knowles; Shape: Rectangular; Impedance: 300R; Voltage Rating: 3.6V; Direction: Omnidirectional; Operating Supply Current: 250uA; Signal to Noise Ratio (SNR): 59dB; Output Type: Analog; Supplier 1: Digi-Key; Manufacturer Part Number: SPU0410HR5H-PB; Stock 1: 83682; Pricing 1: 1=0.82, 10=0.688, 25=0.6376, 50=0.6006, 100=0.5649, 500=0.48696 (USD); Package Quantity: 1200; Packaging: Tape and Reel; Operating Supply Voltage: 3.6V; Termination: SMD/SMT; Length: 3.76mm; Height: 1.2mm; Width: 2.95mm; Depth: 1.2mm; ComponentLink1URL: https://media.digikey.com/pdf/Data%20Sheets/Knowles%20Acoustics%20PDFs/SiSonic_Design_Guide.pdf?src-supplier=Mouser; ComponentLink1Description: https://media.digikey.com/pdf/Data%20Sheets/Knowles%20Acoustics%20PDFs/SiSonic_Design_Guide.pdf?src-supplier=Mouser; ComponentLink2URL: https://media.digikey.com/pdf/Data%20Sheets/Knowles%20Acoustics%20PDFs/SiSonic_Design_Guide.pdf?src-supplier=Digi-Key; ComponentLink2Description: https://media.digikey.com/pdf/Data%20Sheets/Knowles%20Acoustics%20PDFs/SiSonic_Design_Guide.pdf?src-supplier=Digi-Key; Supplier Part Number 1: 423-1138-1-ND
U2 U3 = OPA344NA/250: IC OPAMP GP 1 CIRCUIT SOT23-5; Manufacturer: Texas Instruments; Nominal Supply Current: 250uA; Bandwidth: 1MHz; Min Supply Voltage: 2.7V; Max Supply Voltage: 5.5V; Voltage Gain: 122dB; Common Mode Rejection Ratio: 76dB; Number of Channels: 1; Slew Rate: 0.8V/µs; Max I/O Voltage: 1mV; Input Bias Current: 10pA; Power Supply Rejection Ratio (PSRR): 90.46dB; Output Current per Channel: 15mA; Quiescent Current: 250mA; Supplier 1: Digi-Key; Manufacturer Part Number: OPA344NA/250; Stock 1: 6132; Pricing 1: 1=1.59, 10=1.43, 25=1.3492, 100=1.0794 (USD); Case/Package: SOT-23; Number of Pins: 5; Min Operating Temperature: -40°C; Max Operating Temperature: 85°C; Packaging: Tape and Reel; Package Quantity: 250; Unity Gain Bandwidth Product: 1MHz; Input Offset Voltage (Vos): 1mV; Gain Bandwidth Product: 1MHz; Number of Circuits: 1; Number of Amplifiers: 1; Number of Elements: 1; Length: 2.9mm; Height: 1.15mm; Width: 1.6mm; Radiation Hardening: No; REACH SVHC: No SVHC; Lead Free: Lead Free; ComponentLink1URL: http://www.ti.com/general/docs/lit/getliterature.tsp?genericPartNumber=OPA344&fileType=pdf&src-supplier=Newark; ComponentLink1Description: http://www.ti.com/general/docs/lit/getliterature.tsp?genericPartNumber=OPA344&fileType=pdf&src-supplier=Newark; ComponentLink2URL: http://www.farnell.com/datasheets/1882856.pdf?src-supplier=Element14; ComponentLink2Description: http://www.farnell.com/datasheets/1882856.pdf?src-supplier=Element14; ComponentLink3URL: http://www.ti.com/lit/ds/symlink/opa344.pdf?src-supplier=Digi-Key; ComponentLink3Description: http://www.ti.com/lit/ds/symlink/opa344.pdf?src-supplier=Digi-Key; ComponentLink4URL: http://focus.ti.com/lit/ds/symlink/opa344.pdf?src-supplier=Avnet+Europe; ComponentLink4Description: http://focus.ti.com/lit/ds/symlink/opa344.pdf?src-supplier=Avnet+Europe; ComponentLink5URL: http://www.ti.com/general/docs/lit/getliterature.tsp?genericPartNumber=OPA4345&&fileType=pdf&src-supplier=Avnet; ComponentLink5Description: http://www.ti.com/general/docs/lit/getliterature.tsp?genericPartNumber=OPA4345&&fileType=pdf&src-supplier=Avnet; Supplier Part Number 1: OPA344NACT-ND
U4 = ADG712BRUZ-REEL: IC SWITCH QUAD SPST 16TSSOP; Manufacturer: Analog Devices; Max Supply Voltage: 5.5V; Min Supply Voltage: 1.8V; Number of Inputs: 4; Max Power Dissipation: 5uW; On-State Resistance: 4R; -3db Bandwidth: 200MHz; Max Supply Current: 1uA; Turn-On Delay Time: 11ns; Turn-Off Delay Time: 6ns; Operating Supply Current: 1nA; Power Dissipation: 430mW; Supply Type: Single; Polarity: Non-Inverting; High Level Output Current: 30mA; Interface: Parallel; Supplier 1: Digi-Key; Manufacturer Part Number: ADG712BRUZ-REEL; Stock 1: 4085; Pricing 1: 1=2.89, 10=2.598, 25=2.4564, 100=2.129, 250=2.01984, 500=1.81238, 1000=1.52852 (USD); Mount: Surface Mount; Case/Package: TSSOP; Number of Pins: 16; Contact Plating: Tin,Matte; Min Operating Temperature: -40°C; Max Operating Temperature: 85°C; Number of Outputs: 4; Number of Channels: 4; Packaging: Tape and Reel; Package Quantity: 1; Number of Circuits: 4; Throw Configuration: SPST; Number of Bits: 4; Bandwidth: 200MHz; Lead Free: Contains Lead; ComponentLink1URL: http://www.analog.com/media/en/technical-documentation/data-sheets/ADG711_712_713.pdf?src-supplier=Digi-Key; ComponentLink1Description: http://www.analog.com/media/en/technical-documentation/data-sheets/ADG711_712_713.pdf?src-supplier=Digi-Key; ComponentLink2URL: http://datasheet.iiic.cc/analog_devices/ADG712BRUZ-REEL.pdf?src-supplier=IIIC; ComponentLink2Description: http://datasheet.iiic.cc/analog_devices/ADG712BRUZ-REEL.pdf?src-supplier=IIIC; Supplier Part Number 1: ADG712BRUZ-REELCT-ND

## Sheet Connector_Section.SchDoc
size A; DocumentNumber: 8; SheetNumber: 8; SheetTotal: 8
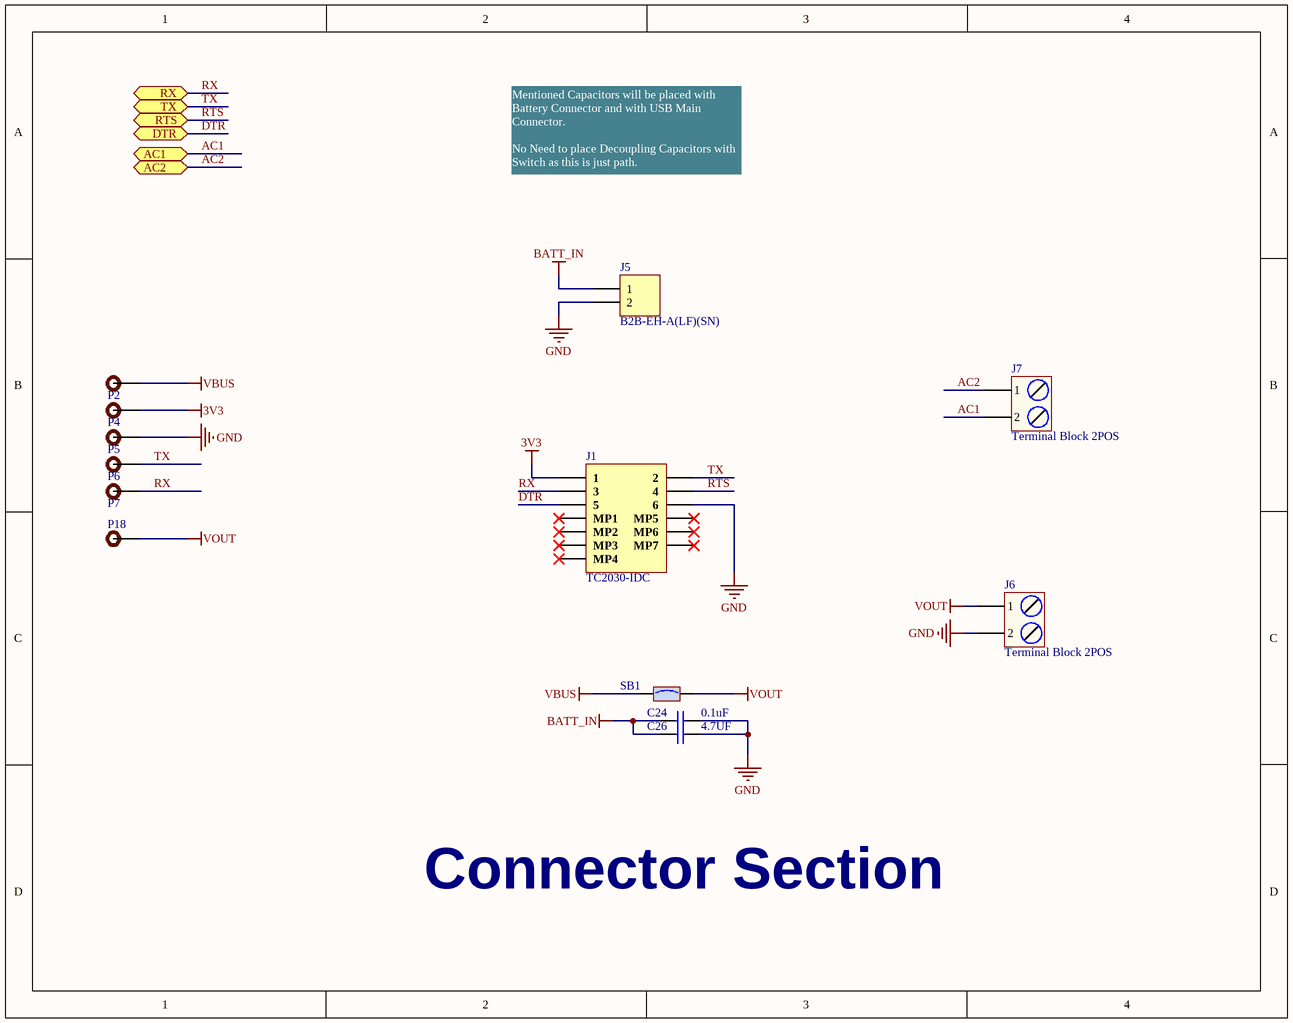
[diagram p3: Connector_Section.SchDoc]

### Parts
C24  0.1uF  [Cap0805]
C26  4.7UF  [Cap0805]
J1  TC2030-IDC  [TC2030-IDC]
J5  B2B-EH-A(LF)(SN)  [B2B-EH-A(LF)(SN)]
J6  Terminal Block 2POS  [Terminal Block 2P]
J7  Terminal Block 2POS  [Terminal Block 2P]
P2  TEST POINT  [TEST POINT]  (value not drawn)
P4  TEST POINT  [TEST POINT]  (value not drawn)
P5  TEST POINT  [TEST POINT]  (value not drawn)
P6  TEST POINT  [TEST POINT]  (value not drawn)
P7  TEST POINT  [TEST POINT]  (value not drawn)
P18  TEST POINT  [TEST POINT]  (value not drawn)
SB1  Solder Bridge  [Solder Bridge]  (value not drawn)

### Ports
AC1 (bidir), AC2 (bidir), DTR (bidir), RTS (bidir), RX (bidir), TX (bidir)

### Nets
3V3: J1.1 P4.1
BATT_IN: C24.1 C26.1 J5.1
GND: C24.2 C26.2 J1.6 J5.2 J6.2 P5.1
VBUS: P2.1 SB1.1
VOUT: J6.1 P18.1 SB1.2
AC1: J7.2 ; port AC1
AC2: J7.1 ; port AC2
DTR: J1.5 ; port DTR
RTS: J1.4 ; port RTS
RX: J1.3 P7.1 ; port RX
TX: J1.2 P6.1 ; port TX

Not connected (* = marked no-connect by the designer): J1 MP1* MP2* MP3* MP4* MP5* MP6* MP7*

### Notes on the sheet
- Mentioned Capacitors will be placed with Battery Connector and with USB Main Connector.
  No Need to place Decoupling Capacitors with Switch as this is just path.
- Connector Section

### Library data of the parts
C24 = CL21F104ZBCNNNC: as C1 on sheet Audio_Section; Supplier 1: Digi-Key; Manufacturer Part Number: CL21F104ZBCNNNC; Stock 1: 4901061; Pricing 1: 1=0.1, 10=0.044, 100=0.0195, 500=0.0139, 1000=0.01092 (USD); Mount: Surface Mount; Case/Package: 0805; Case Code (Metric): 2012; Case Code (Imperial): 0805; Min Operating Temperature: -30°C; Max Operating Temperature: 85°C; Dielectric: Y5V; Packaging: Tape and Reel; Voltage Rating: 50V; Package Quantity: 1; Length: 2mm; Height: 0.85mm; Width: 0.049inch; Thickness: 0.037inch; Depth: 1.25mm; Radiation Hardening: No; ComponentLink1URL: https://media.digikey.com/pdf/Data%20Sheets/Samsung%20PDFs/CL_Series_MLCC_ds.pdf?src-supplier=Digi-Key; ComponentLink1Description: https://media.digikey.com/pdf/Data%20Sheets/Samsung%20PDFs/CL_Series_MLCC_ds.pdf?src-supplier=Digi-Key; Supplier Part Number 1: 1276-1007-6-ND
C26 = C0805C475K4PACTU: CAP CER 4.7UF 16V 10% X5R 0805; Manufacturer: KEMET; Dielectric Material: Ceramic; ComponentLink1URL: http://www.samsungsem.com/global/support/library/product-catalog/__icsFiles/afieldfile/2014/11/13/MLCC.pdf?src-supplier=Digi-Key; ComponentLink1Description: http://www.samsungsem.com/global/support/library/product-catalog/__icsFiles/afieldfile/2014/11/13/MLCC.pdf?src-supplier=Digi-Key; ComponentLink2URL: http://www1.futureelectronics.com/doc/SAMSUNG%20PASSIVE/CL05B104KQ5NNNC.pdf?src-supplier=Future+Electronics; ComponentLink2Description: http://www1.futureelectronics.com/doc/SAMSUNG%20PASSIVE/CL05B104KQ5NNNC.pdf?src-supplier=Future+Electronics; ComponentLink3URL: https://www.distrelec.biz/Web/Downloads/_e/ng/MLCC_CatalogDownload2013_ENG.pdf?mime=application%2Fpdf&src-supplier=Distrelec; ComponentLink3Description: https://www.distrelec.biz/Web/Downloads/_e/ng/MLCC_CatalogDownload2013_ENG.pdf?mime=application%2Fpdf&src-supplier=Distrelec; ComponentLink4URL: https://produktinfo.conrad.com/datenblaetter/450000-474999/455935-da-01-en-VS_KONDENSATOR_0805.pdf?src-supplier=Conrad; ComponentLink4Description: https://produktinfo.conrad.com/datenblaetter/450000-474999/455935-da-01-en-VS_KONDENSATOR_0805.pdf?src-supplier=Conrad; Supplier 1: Newark; Manufacturer Part Number: C0805C475K4PACTU; Stock 1: 22500; Pricing 1: 1=0.142, 2500=0.14, 5000=0.139, 10000=0.137 (USD); Mount: Surface Mount; Case/Package: 0805; Min Operating Temperature: -55°C; Max Operating Temperature: 85°C; Capacitance: 4.7uF; Tolerance: 10%; Packaging: Tape and Reel; Dielectric: X5R; Voltage: 16V; Termination: SMD/SMT; Voltage Rating (DC): 16V; Length: 2mm; Height: 1.25mm; Depth: 1.25mm; Radiation Hardening: No; Lead Free: Lead Free; ComponentLink5URL: http://capacitoredge.kemet.com/capedge2/DataSheet?pn=C0805C475K4PAC7800&src-supplier=Avnet+Europe; ComponentLink5Description: http://capacitoredge.kemet.com/capedge2/DataSheet?pn=C0805C475K4PAC7800&src-supplier=Avnet+Europe; ComponentLink6URL: https://www.verical.com/server-webapp/html/getDatasheet?partID=319476&src-supplier=Verical; ComponentLink6Description: https://www.verical.com/server-webapp/html/getDatasheet?partID=319476&src-supplier=Verical; Supplier Part Number 1: 36X2756
J1 = TC2030-IDC: CABLE ADAPTER 6 POS; Manufacturer: Tag-Connect; ComponentLink1URL: http://www.tag-connect.com/Materials/TC2030-MCP%20Datasheet.pdf?src-supplier=Digi-Key; ComponentLink1Description: http://www.tag-connect.com/Materials/TC2030-MCP%20Datasheet.pdf?src-supplier=Digi-Key; Supplier 1: Digi-Key; Manufacturer Part Number: TC2030-IDC; Stock 1: 284; Pricing 1: 1=43.71 (USD); Package Quantity: 1; Supplier Part Number 1: TC2030-IDC-ND
J5 = B2B-EH-A(LF)(SN): CONN HEADER VERT 2POS 2.5MM; Manufacturer: JST; Current Rating: 3A; Voltage Rating: 250V; Contact Resistance: 20mR; Number of Positions: 2; Connector Type: Male Pin,Plug; Gender: Male; Supplier 1: Digi-Key; Manufacturer Part Number: B2B-EH-A(LF)(SN); Stock 1: 25023; Pricing 1: 1=0.14, 10=0.131, 100=0.0809, 500=0.06698, 1000=0.05861, 5000=0.05024, 10000=0.04884 (USD); Mount: Through Hole; Contact Material: Copper Alloy,Brass; Color: Natural; Contact Plating: Tin,Copper; Housing Color: White; Housing Material: Nylon; Min Operating Temperature: -25°C; Max Operating Temperature: 85°C; Number of Rows: 1; Fastening Type: Detent; Packaging: Bulk; Max Current Rating: 3A; Termination: Press-Fit; Number of Contacts: 2; Max Voltage Rating (AC): 250V; Orientation: Straight; Length: 7.5mm; Pitch: 2.5mm; Contact Mating Length: 0.13inch; Depth: 3.8mm; Lead Free: Lead Free; ComponentLink1URL: http://uk.rs-online.com/webdocs/05aa/0900766b805aab1f.pdf?src-supplier=RSComponents; ComponentLink1Description: http://uk.rs-online.com/webdocs/05aa/0900766b805aab1f.pdf?src-supplier=RSComponents; ComponentLink2URL: http://www.jst-mfg.com/product/pdf/eng/eEH.pdf?src-supplier=Digi-Key; ComponentLink2Description: http://www.jst-mfg.com/product/pdf/eng/eEH.pdf?src-supplier=Digi-Key; ComponentLink3URL: https://www.verical.com/server-webapp/html/getDatasheet?partID=639961&src-supplier=Verical; ComponentLink3Description: https://www.verical.com/server-webapp/html/getDatasheet?partID=639961&src-supplier=Verical; ComponentLink4URL: http://www1.futureelectronics.com/doc/JST/B2B-EH-A(LF)(SN).pdf?src-supplier=Future+Electronics; ComponentLink4Description: http://www1.futureelectronics.com/doc/JST/B2B-EH-A(LF)(SN).pdf?src-supplier=Future+Electronics; ComponentLink5URL: http://www.produktinfo.conrad.com/datenblaetter/1200000-1299999/001217319-da-01-en-STIFTLEISTE_GERADE_2_POL__RM_25MM.pdf?src-supplier=Conrad; ComponentLink5Description: http://www.produktinfo.conrad.com/datenblaetter/1200000-1299999/001217319-da-01-en-STIFTLEISTE_GERADE_2_POL__RM_25MM.pdf?src-supplier=Conrad; Supplier Part Number 1: 455-1611-ND
J6 J7 = Terminal Block 2POS: TERMINAL BLOCK 2POS 5.08MM SIDE; Manufacturer: TE Connectivity; Manufacturer P/N: 1776493-2
P2 P4-P7 P18 = TEST POINT: Test Point ON
SB1 = Solder Bridge: Solder Bridge ON